# Altium schematic sheet 06_eMMC_SDIO_SPINAND_SPINOR.SchDoc
size 363 x 215 mm; DsnPath: C:\Users\nilot\Documents\VSCode\SBC\imports\SG2002_QFN88_38_20230301_4L_V1.3_16.2.DSN; SchematicName: CV181xC_QFN88_38_DemoBoard; PageName: 06_eMMC_SDIO_SPINAND_SPINOR; PageSize: Custom; TopSchematic: True
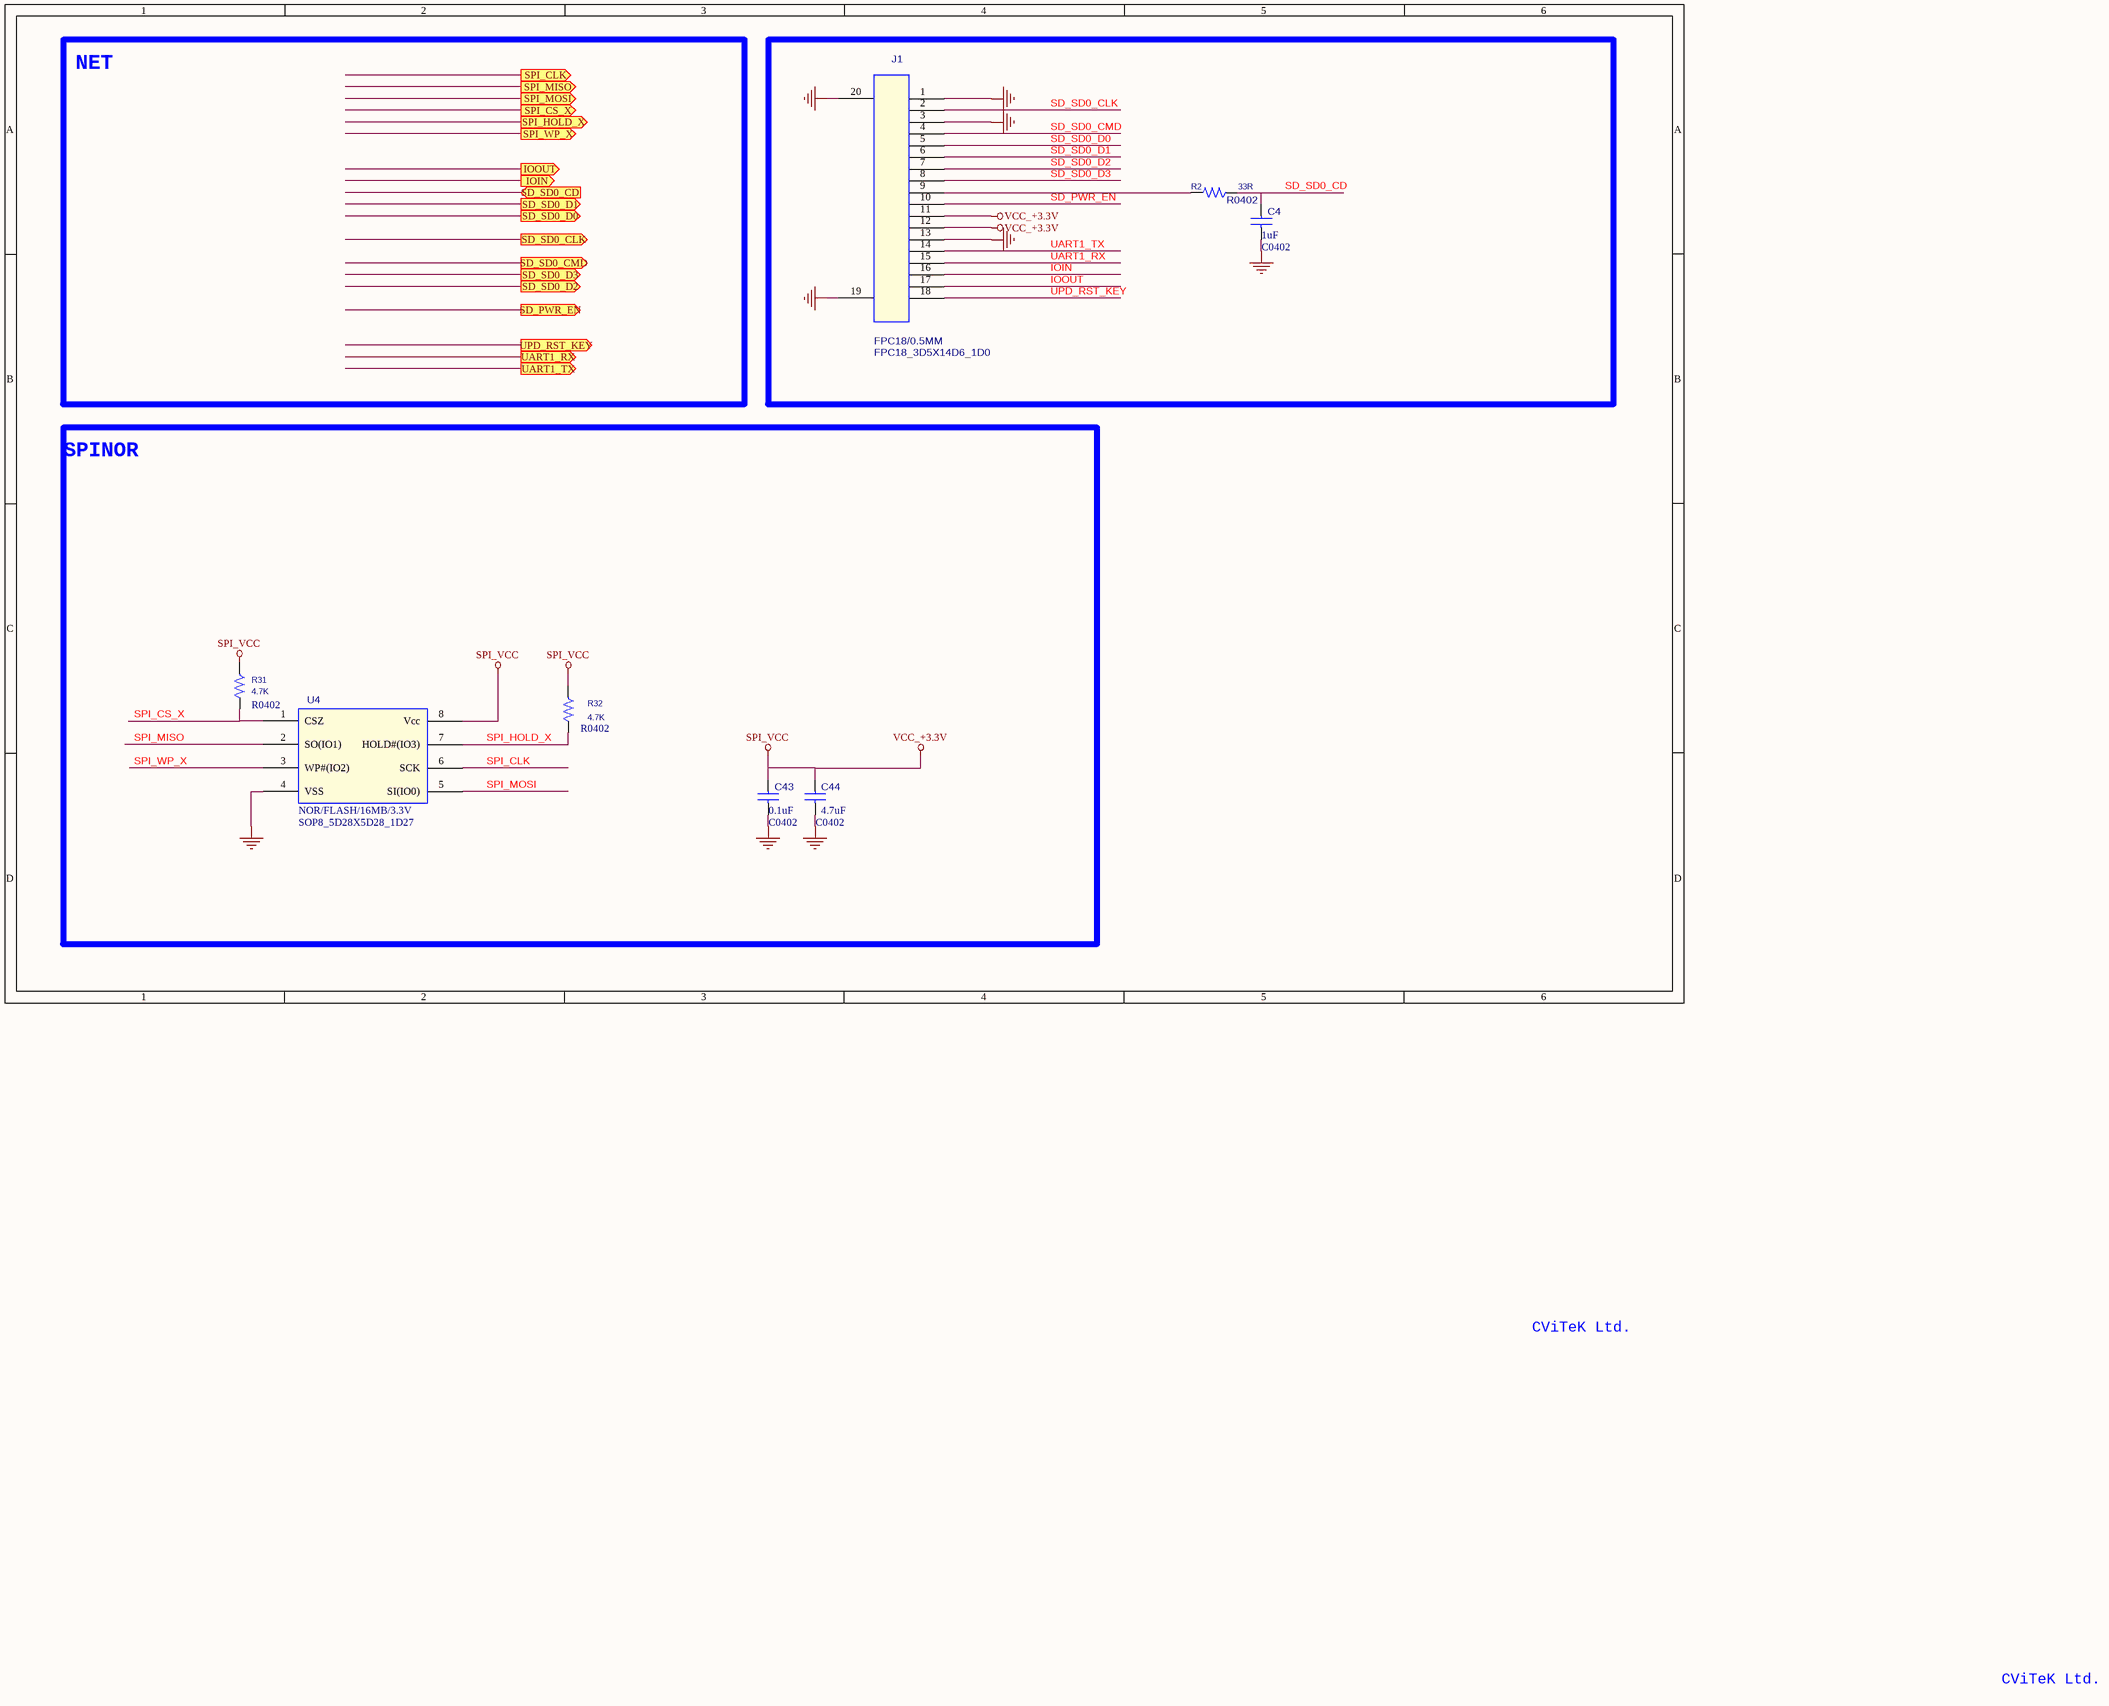
[diagram p0: 06_eMMC_SDIO_SPINAND_SPINOR.SchDoc]

## Parts
C4  1uF  [C0402]
C43  0.1uF  [C0402]
C44  4.7uF  [C0402]
J1  FPC18/0.5MM  [FPC18_3D5X14D6_1D0]
R2  33R  [R0402]
R31  4.7K  [R0402]
R32  4.7K  [R0402]
U4  NOR/FLASH/16MB/3.3V  PCB Footprint: SOP8_5D28X5D28_1D27  [BGA4-0_5-0202-1X1]

## Blocks framed on the sheet
SPINOR: C43 C44 R31 R32 U4

## Ports
IOIN (out), IOOUT (out), SD_PWR_EN (out), SD_SD0_CD (in), SD_SD0_CLK (out), SD_SD0_CMD (out), SD_SD0_D0 (out), SD_SD0_D1 (out), SD_SD0_D2 (out), SD_SD0_D3 (out), SPI_CLK (out), SPI_CS_X (out), SPI_HOLD_X (out), SPI_MISO (out), SPI_MOSI (out), SPI_WP_X (out), UART1_RX (out), UART1_TX (out), UPD_RST_KEY (out)

## Nets
GND: C4.2 C43.2 C44.2 J1.1 J1.3 J1.13 J1.19 J1.20 U4.4(VSS)
SPI_VCC: C43.1 C44.1 J1.11 J1.12 R31.1 R32.1 U4.8(Vcc)  [also labelled VCC_+3.3V]
IOIN: J1.16
IOOUT: J1.17
SD_PWR_EN: J1.10
SD_SD0_CD: C4.1 R2.1
SD_SD0_CLK: J1.2
SD_SD0_CMD: J1.4
SD_SD0_D0: J1.5
SD_SD0_D1: J1.6
SD_SD0_D2: J1.7
SD_SD0_D3: J1.8
SPI_CLK: U4.6(SCK)
SPI_CS_X: R31.2 U4.1(CSZ)
SPI_HOLD_X: R32.2 U4.7(HOLD#(IO3))
SPI_MISO: U4.2(SO(IO1))
SPI_MOSI: U4.5(SI(IO0))
SPI_WP_X: U4.3(WP#(IO2))
UART1_RX: J1.15
UART1_TX: J1.14
UPD_RST_KEY: J1.18
NetJ1_9: J1.9 R2.2

## Notes on the sheet
- NET
- CViTeK Ltd.

## Library data of the parts
C4 = C: C0402; Part Number: GRM155R61E104KA87D; Part Reference: C4; Cloud IC Number: Y02110431K00; Vendor: murata; Part Name: C0402; Value: 1uF; PCB Footprint: C0402
C43 = C: C0402; Part Number: GRM155R61E104KA87D; Part Reference: C43; Cloud IC Number: Y02110431K00; Vendor: murata; Part Name: C0402; Value: 0.1uF; PCB Footprint: C0402
C44 = C: C0402; Part Number: GRM155R61E104KA87D; Part Reference: C44; Cloud IC Number: Y02110431K00; Vendor: murata; Part Name: C0402; Value: 4.7uF; PCB Footprint: C0402
J1 = CON12_0: Part Reference: J1; Value: FPC18/0.5MM; PCB Footprint: FPC18_3D5X14D6_1D0
R2 = R_Dup1: R0402; Part Reference: R2; Part Number: Y01102201F00; Value: 33R; PCB Footprint: R0402; Manufacturer Part number: Y01102201F00; Part Name: R0402
R31 = R_Dup1: R0402; Part Reference: R31; Manufacturer Part number: Y01104731F00; Value: 4.7K; Part Number: Y01104731F00; Part Name: R0402; PCB Footprint: R0402
R32 = R_Dup1: R0402; Part Reference: R32; Manufacturer Part number: Y01104731F00; Value: 4.7K; Part Number: Y01104731F00; Part Name: R0402; PCB Footprint: R0402
U4 = ESMT_SPINOR_WSON8_5: ESMT_SPINOR_8-C WSON; Part Reference: U4; NANE: SPINOR_WSON8; Value: NOR/FLASH/16MB/3.3V